# EAGLE design new_horna_podstava (EAGLE 9.6.2)
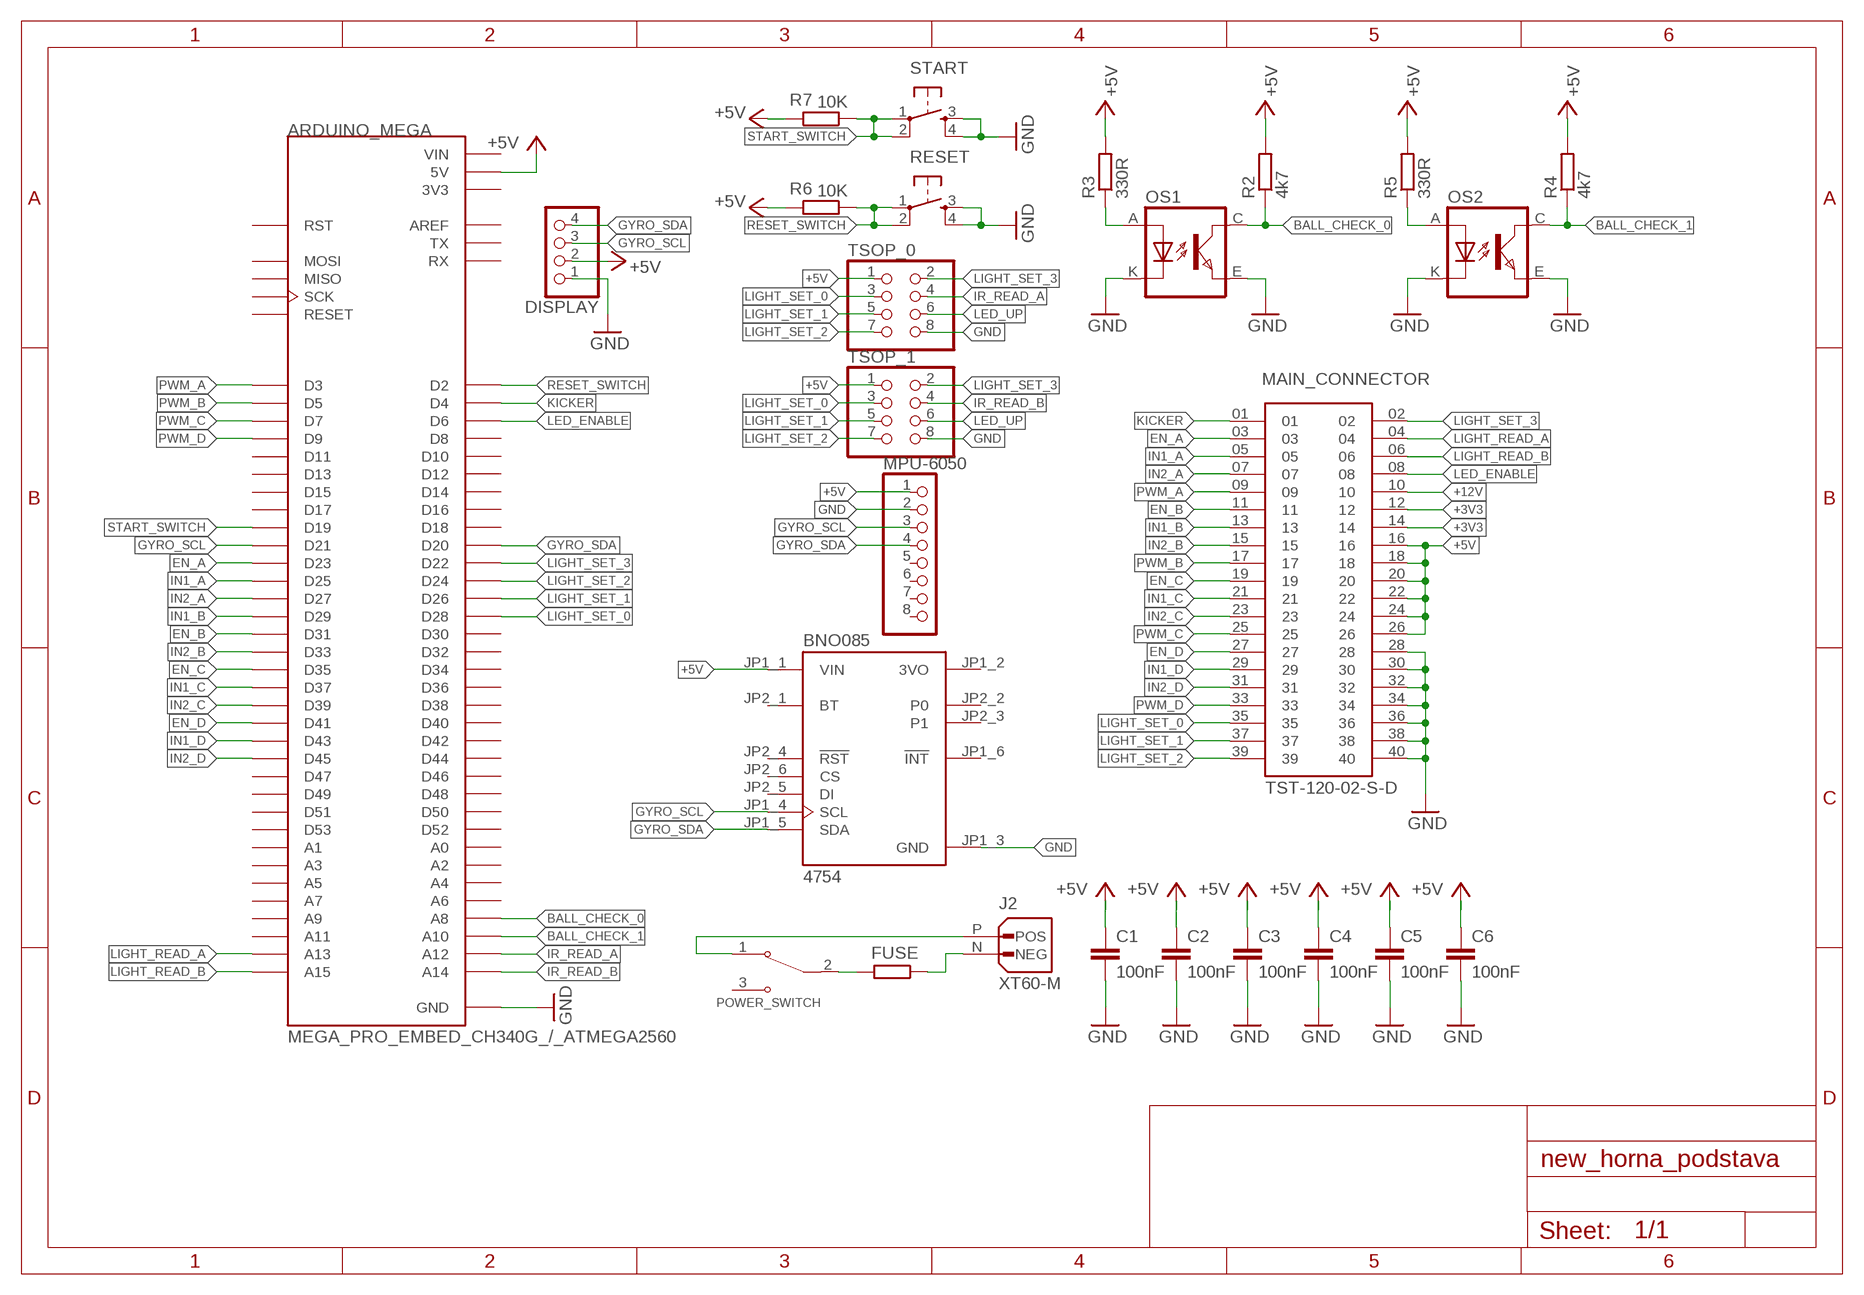
[diagram p0: schematic, sheet 1]

## Parts
ARDUINO_MEGA  MEGA_PRO_EMBED_CH340G_/_ATMEGA2560  [MODULE_MEGA_PRO_EMBED_CH340G_/_ATMEGA2560]
BNO085  4754  [MODULE_4754]
C1  100nF  C-EUC0805  [C0805]
C2  100nF  C-EUC0805  [C0805]
C3  100nF  C-EUC0805  [C0805]
C4  100nF  C-EUC0805  [C0805]
C5  100nF  C-EUC0805  [C0805]
C6  100nF  C-EUC0805  [C0805]
DISPLAY  PINHD-1X4  [1X04]
FUSE  R-EU_R1206  [R1206]
J2  XT60-M  [AMASS_XT60-M]
MAIN_CONNECTOR  TST-120-02-S-D  [SAMTEC_TST-120-02-S-D]
MPU-6050  PINHD-1X8  [1X08]
OS1  TCRT5000  [TCRT5000]
OS2  TCRT5000  [TCRT5000]
POWER_SWITCH  100SP1T1B4M2QE  [SW_100SP1T1B4M2QE]
R2  4k7  R-EU_R1206  [R1206]
R3  330R  R-EU_R1206  [R1206]
R4  4k7  R-EU_R1206  [R1206]
R5  330R  R-EU_R1206  [R1206]
R6  10K  R-EU_R1206  [R1206]
R7  10K  R-EU_R1206  [R1206]
RESET  DTSM-6  [DTSM-6]
START  DTSM-6  [DTSM-6]
TSOP_0  PINHD-2X4  [2X04]
TSOP_1  PINHD-2X4  [2X04]

## Nets
+3V3: MAIN_CONNECTOR.12 MAIN_CONNECTOR.14
+5V: ARDUINO_MEGA.5V_1(5V) ARDUINO_MEGA.5V_2(5V) ARDUINO_MEGA.5V_3(5V) BNO085.JP1_1(VIN) C1.1 C2.1 C3.1 C4.1 C5.1 C6.1 DISPLAY.2 MAIN_CONNECTOR.16 MAIN_CONNECTOR.18 MAIN_CONNECTOR.20 MAIN_CONNECTOR.22 MAIN_CONNECTOR.24 MAIN_CONNECTOR.26 MPU-6050.1 R2.2 R3.2 R4.2 R5.2 R6.2 R7.2 TSOP_0.1 TSOP_1.1
+12V: MAIN_CONNECTOR.10
BALL_CHECK_0: ARDUINO_MEGA.A8 OS1.C(COLLECTOR) R2.1
BALL_CHECK_1: ARDUINO_MEGA.A10 OS2.C(COLLECTOR) R4.1
EN_A: ARDUINO_MEGA.D23 MAIN_CONNECTOR.03
EN_B: ARDUINO_MEGA.D31 MAIN_CONNECTOR.11
EN_C: ARDUINO_MEGA.D35 MAIN_CONNECTOR.19
EN_D: ARDUINO_MEGA.D41 MAIN_CONNECTOR.27
GND: ARDUINO_MEGA.GND_1(GND) ARDUINO_MEGA.GND_2(GND) ARDUINO_MEGA.GND_3(GND) BNO085.JP1_3(GND) C1.2 C2.2 C3.2 C4.2 C5.2 C6.2 DISPLAY.1 MAIN_CONNECTOR.28 MAIN_CONNECTOR.30 MAIN_CONNECTOR.32 MAIN_CONNECTOR.34 MAIN_CONNECTOR.36 MAIN_CONNECTOR.38 MAIN_CONNECTOR.40 MPU-6050.2 OS1.E(EMITTER) OS1.K(CATHODE) OS2.E(EMITTER) OS2.K(CATHODE) RESET.3 RESET.4 START.3 START.4 TSOP_0.8 TSOP_1.8
GYRO_SCL: ARDUINO_MEGA.D21 BNO085.JP1_4(SCL) DISPLAY.3 MPU-6050.3
GYRO_SDA: ARDUINO_MEGA.D20 BNO085.JP1_5(SDA) DISPLAY.4 MPU-6050.4
IN1_A: ARDUINO_MEGA.D25 MAIN_CONNECTOR.05
IN1_B: ARDUINO_MEGA.D29 MAIN_CONNECTOR.13
IN1_C: ARDUINO_MEGA.D37 MAIN_CONNECTOR.21
IN1_D: ARDUINO_MEGA.D43 MAIN_CONNECTOR.29
IN2_A: ARDUINO_MEGA.D27 MAIN_CONNECTOR.07
IN2_B: ARDUINO_MEGA.D33 MAIN_CONNECTOR.15
IN2_C: ARDUINO_MEGA.D39 MAIN_CONNECTOR.23
IN2_D: ARDUINO_MEGA.D45 MAIN_CONNECTOR.31
IR_READ_A: ARDUINO_MEGA.A12 TSOP_0.4
IR_READ_B: ARDUINO_MEGA.A14 TSOP_1.4
KICKER: ARDUINO_MEGA.D4 MAIN_CONNECTOR.01
LED_ENABLE: ARDUINO_MEGA.D6 MAIN_CONNECTOR.08
LED_UP: TSOP_0.6 TSOP_1.6
LIGHT_READ_A: ARDUINO_MEGA.A13 MAIN_CONNECTOR.04
LIGHT_READ_B: ARDUINO_MEGA.A15 MAIN_CONNECTOR.06
LIGHT_SET_0: ARDUINO_MEGA.D28 MAIN_CONNECTOR.35 TSOP_0.3 TSOP_1.3
LIGHT_SET_1: ARDUINO_MEGA.D26 MAIN_CONNECTOR.37 TSOP_0.5 TSOP_1.5
LIGHT_SET_2: ARDUINO_MEGA.D24 MAIN_CONNECTOR.39 TSOP_0.7 TSOP_1.7
LIGHT_SET_3: ARDUINO_MEGA.D22 MAIN_CONNECTOR.02 TSOP_0.2 TSOP_1.2
N$1: FUSE.2 POWER_SWITCH.2
N$2: J2.P(POS) POWER_SWITCH.1
N$3: FUSE.1 J2.N(NEG)
N$5: OS2.A(ANODE) R5.1
N$6: OS1.A(ANODE) R3.1
PWM_A: ARDUINO_MEGA.D3 MAIN_CONNECTOR.09
PWM_B: ARDUINO_MEGA.D5 MAIN_CONNECTOR.17
PWM_C: ARDUINO_MEGA.D7 MAIN_CONNECTOR.25
PWM_D: ARDUINO_MEGA.D9 MAIN_CONNECTOR.33
RESET_SWITCH: ARDUINO_MEGA.D2 R6.1 RESET.1 RESET.2
START_SWITCH: ARDUINO_MEGA.D19 R7.1 START.1 START.2
Unconnected: ARDUINO_MEGA.A0 ARDUINO_MEGA.A1 ARDUINO_MEGA.A2 ARDUINO_MEGA.A3 ARDUINO_MEGA.A4 ARDUINO_MEGA.A5 ARDUINO_MEGA.A6 ARDUINO_MEGA.A7 ARDUINO_MEGA.A9 ARDUINO_MEGA.A11 ARDUINO_MEGA.AREF ARDUINO_MEGA.D8 ARDUINO_MEGA.D10 ARDUINO_MEGA.D11 ARDUINO_MEGA.D12 ARDUINO_MEGA.D13 ARDUINO_MEGA.D14 ARDUINO_MEGA.D15 ARDUINO_MEGA.D16 ARDUINO_MEGA.D17 ARDUINO_MEGA.D18 ARDUINO_MEGA.D30 ARDUINO_MEGA.D32 ARDUINO_MEGA.D34 ARDUINO_MEGA.D36 ARDUINO_MEGA.D38 ARDUINO_MEGA.D40 ARDUINO_MEGA.D42 ARDUINO_MEGA.D44 ARDUINO_MEGA.D46 ARDUINO_MEGA.D47 ARDUINO_MEGA.D48 ARDUINO_MEGA.D49 ARDUINO_MEGA.D50 ARDUINO_MEGA.D51 ARDUINO_MEGA.D52 ARDUINO_MEGA.D53 ARDUINO_MEGA.MISO ARDUINO_MEGA.MOSI ARDUINO_MEGA.RESET ARDUINO_MEGA.RST ARDUINO_MEGA.RX ARDUINO_MEGA.SCK ARDUINO_MEGA.TX ARDUINO_MEGA.VIN_1(VIN) ARDUINO_MEGA.VIN_2(VIN) BNO085.JP1_2(3VO) BNO085.JP1_6(!INT) BNO085.JP2_1(BT) BNO085.JP2_2(P0) BNO085.JP2_3(P1) BNO085.JP2_4(!RST) BNO085.JP2_5(DI) BNO085.JP2_6(CS) MPU-6050.5 MPU-6050.6 MPU-6050.7 MPU-6050.8 POWER_SWITCH.3

## Power pins joined to a net without a drawn wire
3V3: ARDUINO_MEGA.3V3_1(3V3) ARDUINO_MEGA.3V3_2(3V3)

## Library data of the parts
ARDUINO_MEGA = MEGA_PRO_EMBED_CH340G___ATMEGA2560:MEGA_PRO_EMBED_CH340G_/_ATMEGA2560: Mega 2560 PRO (Embed) CH340G/ATmega2560-16AU Check availability <https://pricing.snapeda.com/parts/Mega%20Pro%20Embed%20CH340G%20/%20ATmega2560/Robotdyn/view-part?ref=eda>; AVAILABILITY: Not in stock; MF: Robotdyn; MP: Mega Pro Embed CH340G / ATmega2560; PACKAGE: None; PRICE: None
BNO085 = 4754:4754: Check availability <https://pricing.snapeda.com/parts/4754/Adafruit/view-part?ref=eda>; AVAILABILITY: In Stock; DESCRIPTION: Adafruit 9-DOF Orientation IMU Fusion Breakout - BNO085 (BNO080) - STEMMA QT / Qwiic; MF: Adafruit; MP: 4754; PACKAGE: None; PRICE: None; PURCHASE-URL: https://pricing.snapeda.com/search/part/4754/?ref=eda
C1-C6 = rcl:C-EU: CAPACITOR, European symbol; SPICEPREFIX: C
DISPLAY = pinhead:PINHD-1X4: PIN HEADER
FUSE R2-R7 = rcl:R-EU_: RESISTOR, European symbol; SPICEPREFIX: R
J2 = XT60-M:XT60-M: Check availability <https://pricing.snapeda.com/parts/XT60-M/AMASS/view-part?ref=eda>; AVAILABILITY: Not in stock; DESCRIPTION: Plug; DC supply; XT60; male; PIN: 2; for cable; soldered; 30A; 500V; MF: AMASS; MP: XT60-M; PACKAGE: Package; PRICE: None
MAIN_CONNECTOR = TST-120-02-S-D:TST-120-02-S-D: Check availability <https://pricing.snapeda.com/parts/TST-120-02-S-D-20/Samtec/view-part?ref=eda>; AVAILABILITY: In Stock; DESCRIPTION: Connector Header Through Hole 40 position 0.100 (2.54mm); MF: Samtec; MP: TST-120-02-S-D-20; PACKAGE: None; PRICE: None; PURCHASE-URL: https://pricing.snapeda.com/search/part/TST-120-02-S-D-20/?ref=eda
MPU-6050 = pinhead:PINHD-1X8: PIN HEADER
OS1 OS2 = tcrt5000:TCRT5000
POWER_SWITCH = 100SP1T1B4M2QE:100SP1T1B4M2QE: Toggle Switch SPDT Through Hole Check availability <https://pricing.snapeda.com/parts/100SP1T1B4M2QE/E-Switch/view-part?ref=eda>; AVAILABILITY: In Stock; DESCRIPTION: Toggle Switch SPDT Through Hole; MF: E-Switch; MP: 100SP1T1B4M2QE; PACKAGE: None; PRICE: None; PURCHASE-URL: https://pricing.snapeda.com/search/part/100SP1T1B4M2QE/?ref=eda
RESET START = switch-tact:DTSM-6
TSOP_0 TSOP_1 = pinhead:PINHD-2X4: PIN HEADER

## Board
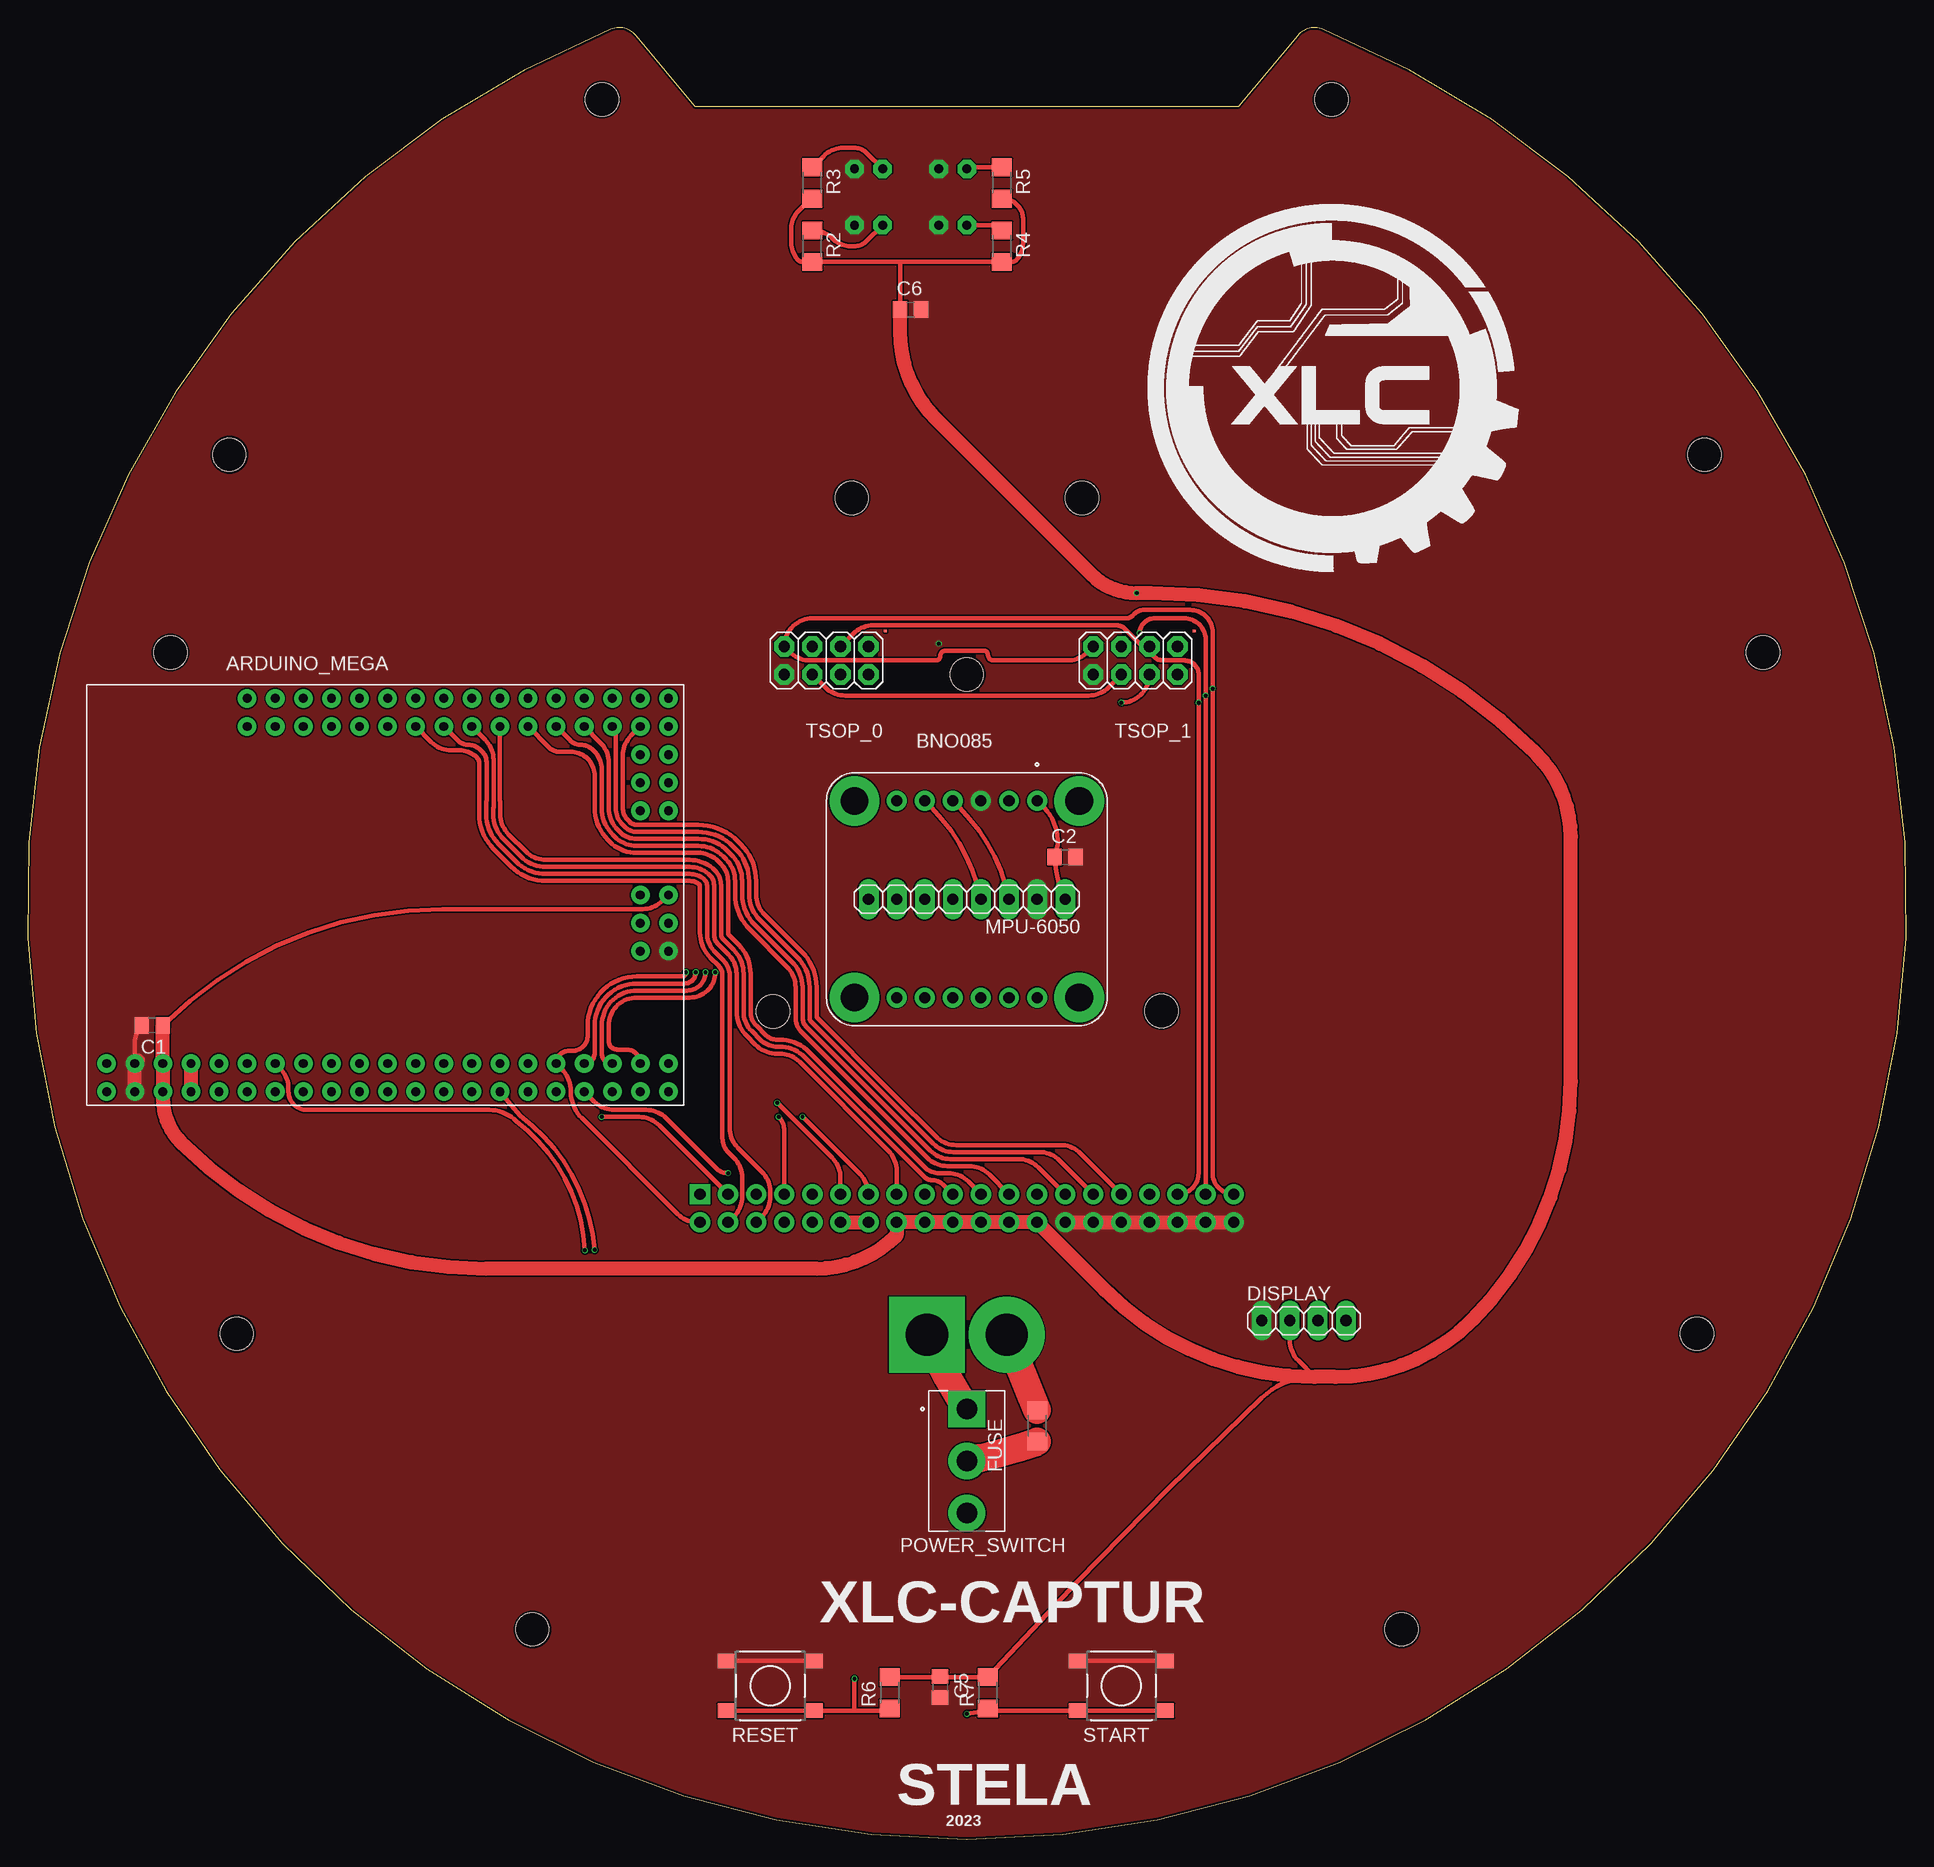
[diagram p1: board, top side]
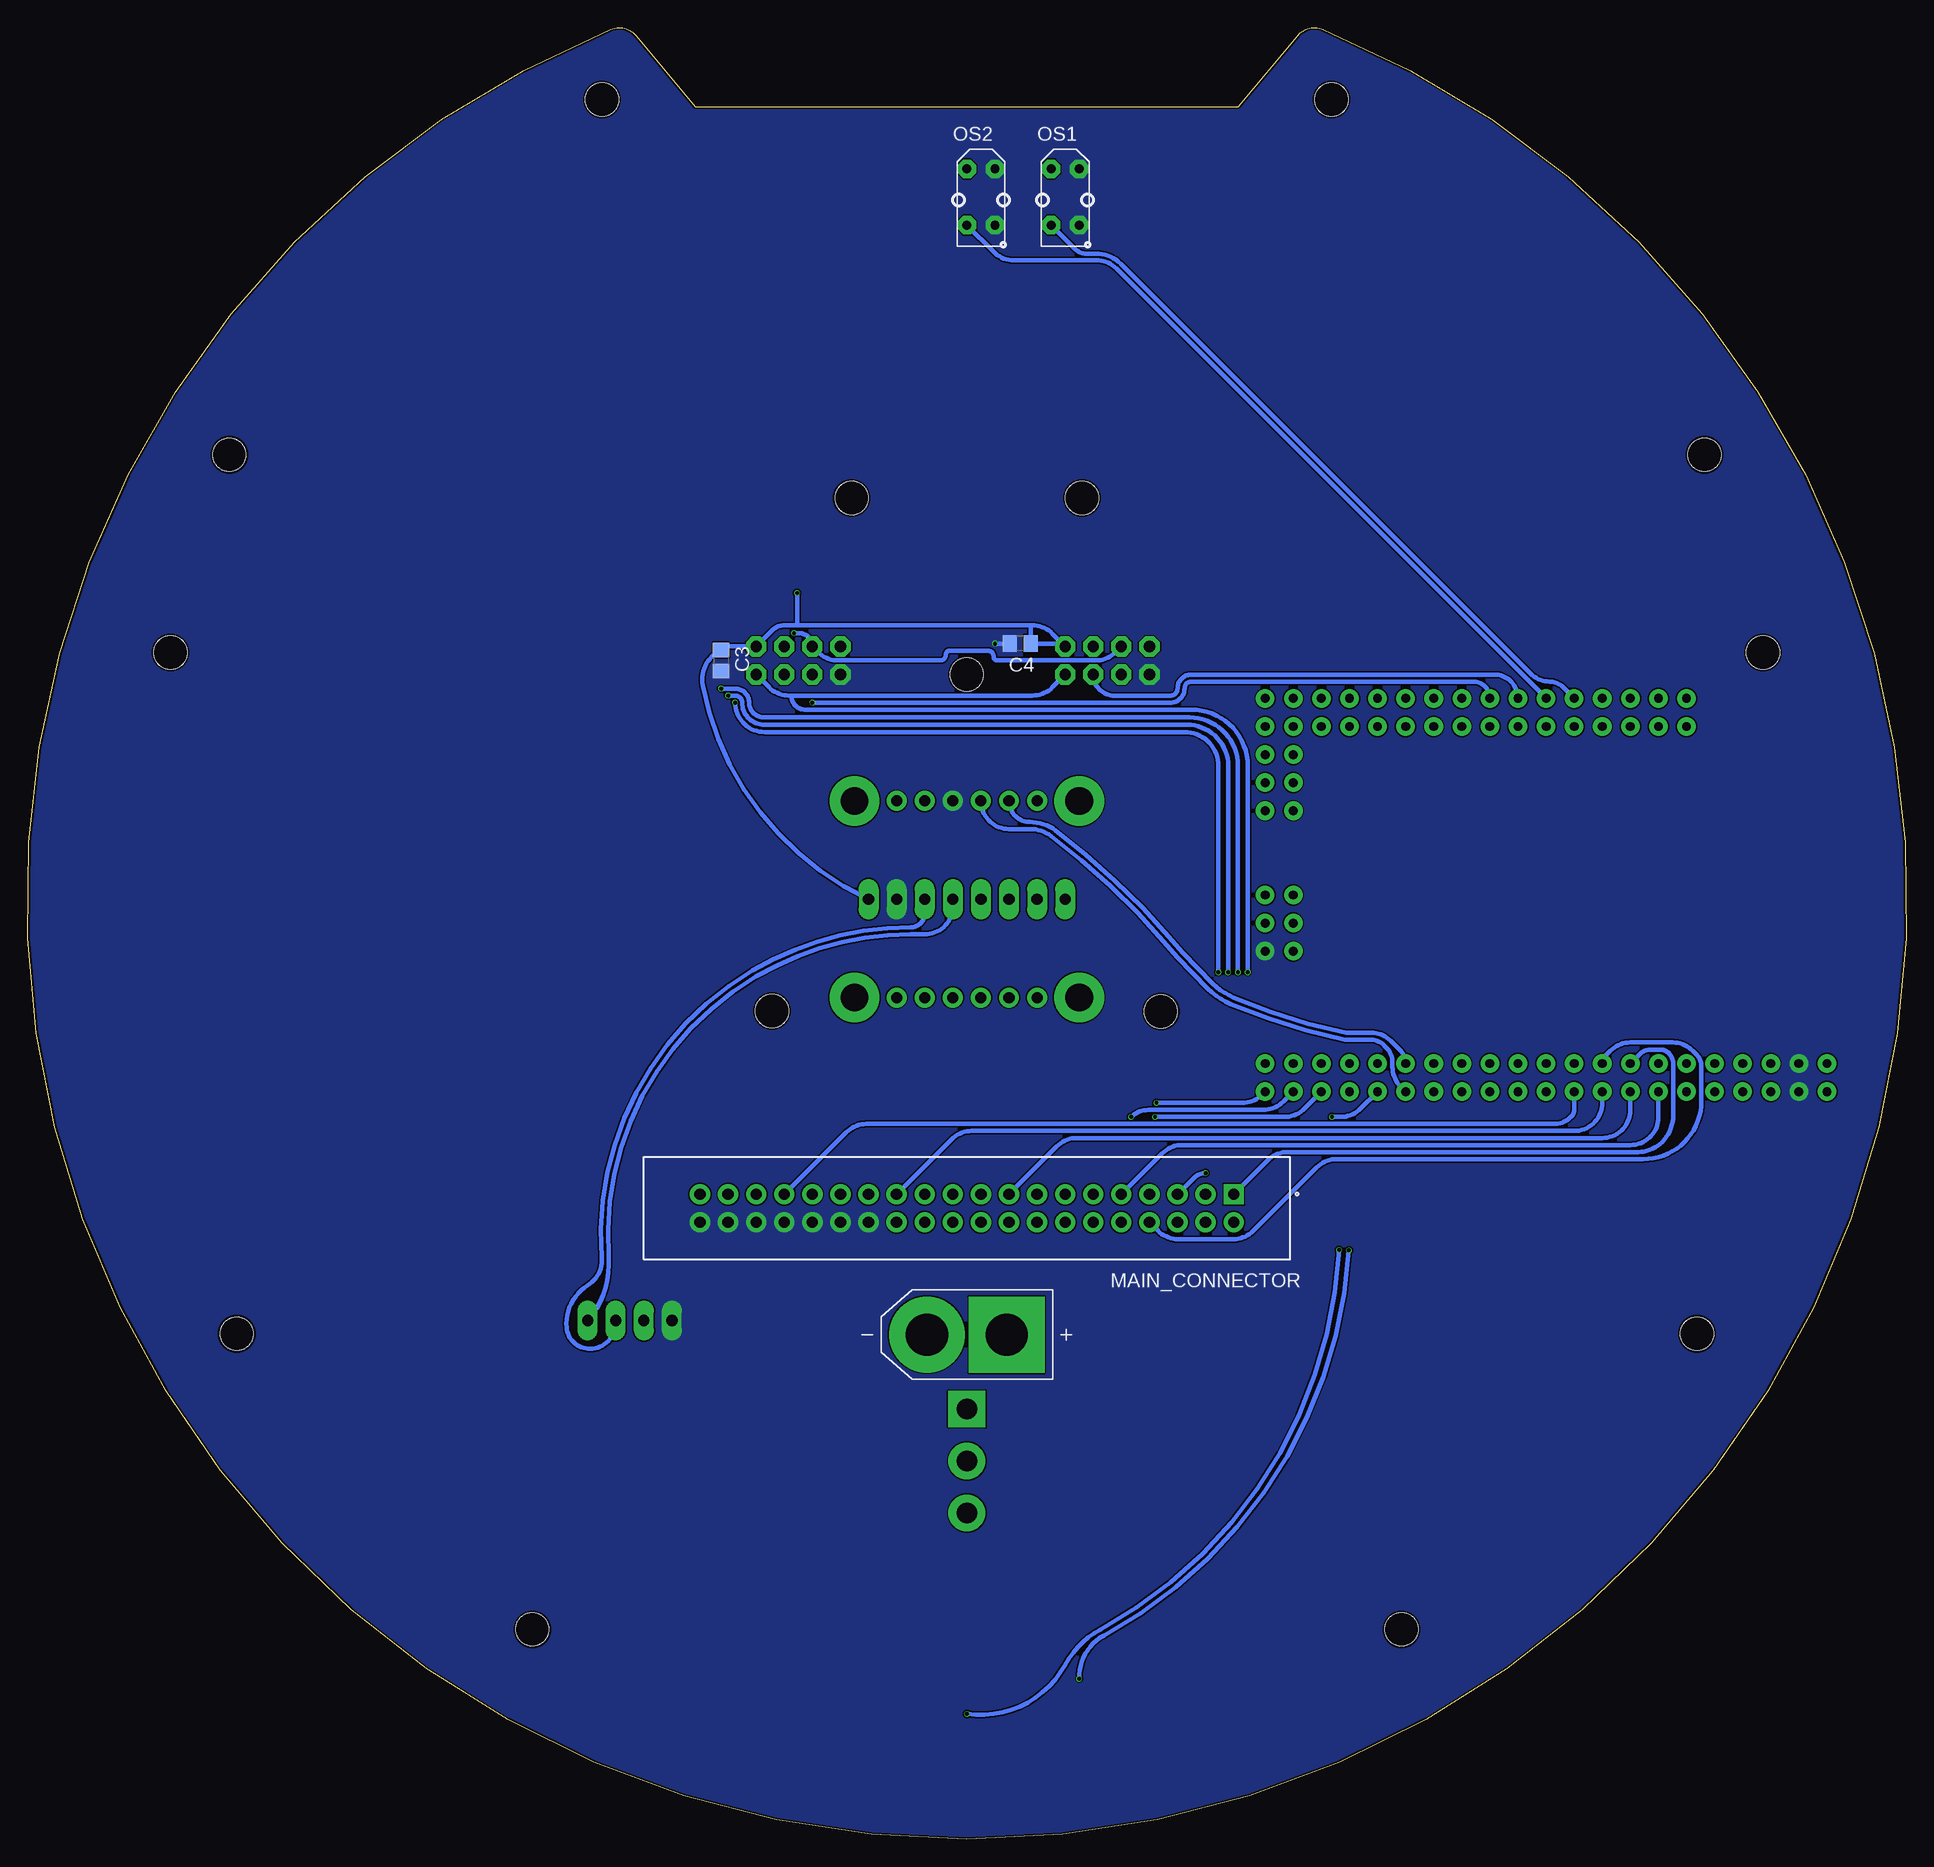
[diagram p2: board, bottom side, seen from below]

Size 169.86 x 163.81 mm. Coordinates in mm from the lower left corner, seen from the top.
Outline: 60.37,156.65 55.03,163.09 arc73 52.73,163.67 arc315 117.13,163.67 arc73 114.83,163.09 109.48,156.65 60.37,156.65
Copper layers (1*16): Top 0.035mm / dielectric 1.6mm / Bottom 0.035mm
Design rules "jlc_pcb": minimum track width 5mil, minimum drill 0.3mm, track to track 5mil, track to pad 5mil, pad to pad 5mil, via to via 5mil, smd to smd 5mil, copper to edge 0.2mm, drill to drill 6mil, minimum pad ring 10mil, minimum via ring 3mil, stop-mask expansion 4mil, vias tented up to drill 0mil, thermal gap 10mil
Holes 3 mm at 156.93,107.32 12.93,107.32 102.54,74.9 67.39,74.86 84.93,105.32 151.62,125.19 150.94,45.71 124.22,18.98 95.34,121.27 74.51,121.27 45.64,18.98 18.91,45.71 18.24,125.19 117.91,157.32 51.94,157.32

### Footprints (pad centres in the part's own frame; a part is rotated, then mirrored left to right if it is on the bottom)
MODULE_MEGA_PRO_EMBED_CH340G_/_ATMEGA2560 = drill 0.8 pad 1.676: 3V3_1 -17.58,-17.78; 3V3_2 -17.58,-15.24; 5V_1 -20.12,-17.78; 5V_2 -20.12,-15.24; 5V_3 25.6,0; A0 -12.5,17.78; A1 -12.5,15.24; A2 -9.96,17.78; A3 -9.96,15.24; A4 -7.42,17.78; A5 -7.42,15.24; A6 -4.88,17.78; A7 -4.88,15.24; A8 -2.34,17.78; A9 -2.34,15.24; A10 0.2,17.78; A11 0.2,15.24; A12 2.74,17.78; A13 2.74,15.24; A14 5.28,17.78; A15 5.28,15.24; AREF -15.04,-15.24; D2 -9.96,-15.24; D3 -9.96,-17.78; D4 -7.42,-15.24; D5 -7.42,-17.78; D6 -4.88,-15.24; D7 -4.88,-17.78; D8 -2.34,-15.24; D9 -2.34,-17.78; D10 0.2,-15.24; D11 0.2,-17.78; D12 2.74,-15.24; D13 2.74,-17.78; D14 5.28,-15.24; D15 5.28,-17.78; D16 7.82,-15.24; D17 7.82,-17.78; D18 10.36,-15.24; D19 10.36,-17.78; D20 12.9,-15.24; D21 12.9,-17.78; D22 15.44,-15.24; D23 15.44,-17.78; D24 17.98,-15.24; D25 17.98,-17.78; D26 20.52,-15.24; D27 20.52,-17.78; D28 23.06,-15.24; D29 23.06,-17.78; D30 25.6,-15.24; D31 25.6,-17.78; D32 7.82,17.78; D33 7.82,15.24; D34 10.36,17.78; D35 10.36,15.24; D36 12.9,17.78; D37 12.9,15.24; D38 15.44,17.78; D39 15.44,15.24; D40 17.98,17.78; D41 17.98,15.24; D42 20.52,17.78; D43 20.52,15.24; D44 23.06,17.78; D45 23.06,15.24; D46 25.6,17.78; D47 25.6,15.24; D48 25.6,12.7; D49 23.06,12.7; D50 25.6,10.16; D51 23.06,10.16; D52 25.6,7.62; D53 23.06,7.62; GND_1 -22.66,-17.78; GND_2 -22.66,-15.24; GND_3 25.6,-5.08; MISO 23.06,0; MOSI 25.6,-2.54; RESET 23.06,-5.08; RST -15.04,-17.78; RX -12.5,-15.24; SCK 23.06,-2.54; TX -12.5,-17.78; VIN_1 -25.2,-17.78; VIN_2 -25.2,-15.24
MODULE_4754 = drill 1 pad 1.778: JP1_1 -6.35,-8.89; JP1_2 -3.81,-8.89; JP1_3 -1.27,-8.89; JP1_4 1.27,-8.89; JP1_5 3.81,-8.89; JP1_6 6.35,-8.89; JP2_1 -6.35,8.89; JP2_2 -3.81,8.89; JP2_3 -1.27,8.89; JP2_4 1.27,8.89; JP2_5 3.81,8.89; JP2_6 6.35,8.89 | drill 2.5 pad 3.2: P1 -10.16,8.89; P2 10.16,8.89; P3 -10.16,-8.89; P4 10.16,-8.89
C0805 = smd 1.3 x 1.5: 1 -0.95,0; 2 0.95,0
1X04 = drill 1.016 long: 1 -3.81,0; 2 -1.27,0; 3 1.27,0; 4 3.81,0
R1206 = smd 1.6 x 1.803: 1 -1.422,0; 2 1.422,0
AMASS_XT60-M = drill 3.81 pad 5.08: N 3.6,0 | drill 3.81 pad 5.08 square: P -3.6,0
SAMTEC_TST-120-02-S-D = drill 1.02 pad 1.37 square: 01 0,0 | drill 1.02 pad 1.37: 02 0,2.54; 03 2.54,0; 04 2.54,2.54; 05 5.08,0; 06 5.08,2.54; 07 7.62,0; 08 7.62,2.54; 09 10.16,0; 10 10.16,2.54; 11 12.7,0; 12 12.7,2.54; 13 15.24,0; 14 15.24,2.54; 15 17.78,0; 16 17.78,2.54; 17 20.32,0; 18 20.32,2.54; 19 22.86,0; 20 22.86,2.54; 21 25.4,0; 22 25.4,2.54; 23 27.94,0; 24 27.94,2.54; 25 30.48,0; 26 30.48,2.54; 27 33.02,0; 28 33.02,2.54; 29 35.56,0; 30 35.56,2.54; 31 38.1,0; 32 38.1,2.54; 33 40.64,0; 34 40.64,2.54; 35 43.18,0; 36 43.18,2.54; 37 45.72,0; 38 45.72,2.54; 39 48.26,0; 40 48.26,2.54
1X08 = drill 1.016 long: 1 -8.89,0; 2 -6.35,0; 3 -3.81,0; 4 -1.27,0; 5 1.27,0; 6 3.81,0; 7 6.35,0; 8 8.89,0
TCRT5000 = drill 0.8 pad 1.676 octagon: A -2.54,-1.27; C 2.54,-1.27; E 2.54,1.27; K -2.54,1.27
SW_100SP1T1B4M2QE = drill 1.85 square: 1 0,4.7 | drill 1.85: 2 0,0; 3 0,-4.7
DTSM-6 = smd 1.55 x 1.3: 1 -3.975,2.25; 2 3.975,2.25; 3 -3.975,-2.25; 4 3.975,-2.25
2X04 = drill 1.016 octagon: 1 -3.81,-1.27; 2 -3.81,1.27; 3 -1.27,-1.27; 4 -1.27,1.27; 5 1.27,-1.27; 6 1.27,1.27; 7 3.81,-1.27; 8 3.81,1.27 | smd 0.254 x 0.254: P$1 -5.334,-2.667

### Placement (x,y rotation side)
ARDUINO_MEGA  32.35,85.38 0 top
BNO085  84.93,85 180 top
C1  11.27,73.57 180 top
C2  93.82,88.81 0 top
C3  107.15,106.59 270 bottom
C4  80.1,108.11 180 bottom
C5  82.51,13.75 270 top
C6  79.85,138.34 0 top
DISPLAY  115.41,46.9 0 top
FUSE  91.28,37.38 270 top
J2  84.93,45.63 180 bottom
MAIN_CONNECTOR  60.8,58.33 180 bottom
MPU-6050  84.93,85 180 top
OS1  76.04,148.5 270 bottom
OS2  83.66,148.5 270 bottom
POWER_SWITCH  84.93,34.2 0 top
R2  70.96,144.06 270 top
R3  70.96,149.77 270 top
R4  88.1,144.06 270 top
R5  88.1,149.77 270 top
R6  77.94,13.25 90 top
R7  86.83,13.25 90 top
RESET  67.15,13.88 180 top
START  98.9,13.88 180 top
TSOP_0  72.23,106.59 180 top
TSOP_1  100.17,106.59 180 top

### Tracks (layer width: path | path; a pad name or v marks a point on that pad's centre or on a via)
3V3
  Top 1.27: ARDUINO_MEGA.3V3_2 ARDUINO_MEGA.3V3_1
+3V3
  Top 1.27: MAIN_CONNECTOR.12 MAIN_CONNECTOR.14
+5V  (via drill 0.35)
  Top 0.406: 78.96,142.63 R4.2 89.01,142.63 arc45 89.37,142.79 arc45 90.01,144.32 90.01,146.6 arc45 89.56,147.68 89.37,147.87 arc45 88.21,148.35 R5.2 | R3.2 arc45 70.7,148.24 69.69,147.23 arc45 69.05,145.7 69.05,144.32 arc45 69.69,142.79 arc45 70.05,142.63 R2.2 71.59,142.63 78.96,142.63 | C6.1 78.9,142.49 arc-45 78.96,142.63 | ARDUINO_MEGA.5V_3 57.42,84.86 arc-45 55.63,84.11 37.49,84.11 arc45 12.41,73.72 12.23,73.54 | DISPLAY.2 114.14,45.09 arc45 114.88,43.29 116.36,41.82 arc44 111.6,39.92 arc4 R7.2 82.39,14.67 | R6.2 82.39,14.67 | C5.1 82.39,14.67 | BNO085.JP1_1 91.91,93.26 arc-66 C2.1 92.93,88.18 arc20 MPU-6050.1
  Top 1.27: C6.1 78.9,136.36 arc45 82.21,128.36 96.19,114.38 arc45 v100.27,112.69 101.52,112.69 arc-45 136.28,98.29 136.45,98.13 arc-45 139.54,90.66 139.54,68.5 arc-45 130.6,46.93 arc-45 118.26,41.82 116.36,41.82 arc-45 97.39,49.68 MAIN_CONNECTOR.26 MAIN_CONNECTOR.24 MAIN_CONNECTOR.22 MAIN_CONNECTOR.20 MAIN_CONNECTOR.18 MAIN_CONNECTOR.16 78.58,54.62 arc-45 71.29,51.6 41.47,51.6 arc-45 13.84,63.05 arc-45 12.23,66.94 ARDUINO_MEGA.5V_1 ARDUINO_MEGA.5V_2 12.23,73.54 arc45 C1.1
  Bottom 0.406: 79.21,109.77 78.99,109.77 arc45 77.2,109.02 TSOP_0.1 arc-45 76.65,108.11 C4.1 79.15,109.62 arc-45 79.21,109.77 | 79.21,109.77 100.27,109.77 | 100.27,109.77 101.45,109.77 arc-45 102.51,109.33 TSOP_1.1 106.38,107.86 arc-45 C3.1 107.64,107.21 arc-66 108.81,104.36 arc-54 MPU-6050.1 | v100.27,112.69 100.27,109.77
BALL_CHECK_0
  Top 0.406: R2.1 71.02,145.48 arc-45 72.82,144.73 72.86,144.69 arc45 74.4,144.06 74.77,144.06 arc45 75.85,144.5 OS1.C
  Bottom 0.406: ARDUINO_MEGA.A8 31.05,104.2 arc-45 32.22,104.69 arc45 33.96,105.4 71.02,142.46 arc-45 73.24,143.38 74.13,143.38 arc45 75.15,143.81 OS1.C
BALL_CHECK_1
  Top 0.406: OS2.C 86.94,145.96 arc-45 R4.1
  Bottom 0.406: ARDUINO_MEGA.A10 71.43,142.04 arc-45 73.23,142.79 80.7,142.79 arc45 82.5,143.53 OS2.C
EN_A  (via drill 0.35)
  Top 0.406: v51.91,65.32 55.3,65.32 arc-45 57.1,64.57 MAIN_CONNECTOR.03
  Bottom 0.406: ARDUINO_MEGA.D23 49.33,66.06 arc45 51.13,65.32 v51.91,65.32
EN_B  (via drill 0.35)
  Top 0.406: v67.78,66.59 72.75,61.61 arc-45 73.5,59.82 MAIN_CONNECTOR.11
  Bottom 0.406: ARDUINO_MEGA.D31 58.22,67.33 arc45 60.02,66.59 v67.78,66.59
EN_C
  Top 0.406: ARDUINO_MEGA.D35 42.71,93.89 42.74,93.86 42.74,92.68 arc45 43.48,90.89 45.07,89.3 arc45 46.86,88.56 59.88,88.56 arc-45 62.14,87.62 arc-45 62.7,86.27 62.7,81.83 | 62.7,81.83 arc45 62.7,81.83 | 62.7,81.83 arc45 62.89,81.38 63.84,80.42 arc-45 64.73,78.27 64.73,74.84 arc45 65.46,73.09 66.25,72.3 arc45 67.78,71.67 68,71.67 arc-45 70.25,70.74 81.12,59.86 arc45 81.75,59.6 arc-45 82.84,59.15 MAIN_CONNECTOR.19
EN_D
  Top 0.406: ARDUINO_MEGA.D41 51.8,99.15 arc-45 52.54,97.36 52.54,93.26 arc45 53.36,91.27 53.55,91.09 arc45 55.06,90.46 60.63,90.46 arc-45 63.33,89.35 63.6,89.07 arc-45 64.61,86.64 64.61,85.42 arc45 65.72,82.72 69.14,79.31 arc-45 70.07,77.06 70.07,74.33 arc45 70.44,73.43 81.63,62.25 arc45 83.42,61.51 89.59,61.51 arc-45 91.39,60.76 MAIN_CONNECTOR.27
GND  (via drill 0.35)
  Top 0.406: ARDUINO_MEGA.GND_2 9.97,70.42 | ARDUINO_MEGA.GND_2 ARDUINO_MEGA.GND_1 | ARDUINO_MEGA.GND_2 9.69,72.05 arc-45 C1.2 | RESET.4 RESET.3 | START.4 START.3
  Top 1.27: MAIN_CONNECTOR.28 MAIN_CONNECTOR.30 MAIN_CONNECTOR.32 MAIN_CONNECTOR.34 MAIN_CONNECTOR.36 MAIN_CONNECTOR.38 MAIN_CONNECTOR.40 | ARDUINO_MEGA.GND_1 9.69,69.74 arc-45 9.97,70.42
  Bottom 0.406: C4.2 v82.39,108.11
  pour Bottom (no thermals): -11.59,168.82 -11.59,-19.77 154.78,-19.77 188.43,-19.77 188.43,145.33 188.43,168.82
  pour Top (no thermals): -11.59,168.82 -11.59,-19.77 188.43,-19.77 188.43,168.82
GYRO_SCL
  Top 0.406: BNO085.JP1_4 84.29,93.26 arc-33 MPU-6050.3
  Bottom 0.406: ARDUINO_MEGA.D21 45.7,68.05 arc45 46.45,69.85 46.45,70.27 arc-45 46.99,71.57 47.18,71.76 arc-45 48.48,72.3 arc1 50.76,72.31 arc12 61.05,75.53 arc21 63.15,76.93 arc5 67.15,81.19 arc-13 77.31,90.72 arc-37 79.21,91.35 81.12,91.35 arc90 BNO085.JP1_4 | MPU-6050.3 88.74,83.73 arc90 90.01,82.46 arc-31 104.3,78.56 arc-64 117.95,52.57 arc62 119.22,50.08 arc-63 121.12,46.27 arc-80 119.22,44.36 arc-100 DISPLAY.3
GYRO_SDA
  Top 0.406: BNO085.JP1_5 81.75,93.26 arc-33 MPU-6050.4
  Bottom 0.406: ARDUINO_MEGA.D20 arc-45 45.75,71.35 46.62,72.22 arc-45 48.35,72.94 50.64,72.94 arc12 60.8,76.11 arc21 62.7,77.38 arc5 66.67,81.6 arc-13 76.93,91.22 arc-37 79.21,91.99 arc90 BNO085.JP1_5 | MPU-6050.4 86.2,84.37 arc90 88.74,81.83 90.01,81.83 arc-31 103.98,78.02 arc-64 117.31,52.62 arc45 DISPLAY.4
IN1_A  (via drill 0.35)
  Top 0.406: ARDUINO_MEGA.D25 51.24,66.69 arc45 53.03,65.95 55.94,65.95 arc-45 57.73,65.21 62.25,60.68 arc45 v63.34,60.24
  Bottom 0.406: v63.34,60.24 arc-45 64.42,59.79 MAIN_CONNECTOR.05
IN1_B  (via drill 0.35)
  Top 0.406: MAIN_CONNECTOR.13 arc45 75.32,60.06 v70.07,65.32
  Bottom 0.406: ARDUINO_MEGA.D29 56.32,66.69 arc45 58.11,65.95 68.54,65.95 arc-45 v70.07,65.32
IN1_C
  Top 0.406: ARDUINO_MEGA.D37 47.14,98.73 arc45 48.1,98.34 49.1,98.34 arc-45 50.64,97.7 arc-45 51.27,96.17 51.27,93.26 arc45 52.47,90.38 52.65,90.19 arc45 55.06,89.19 60.63,89.19 arc-45 62.43,88.45 62.7,88.18 arc-45 63.34,86.64 63.34,84.15 | 63.34,84.15 arc-45 63.34,84.15 | 63.34,84.15 63.34,81.83 64.29,80.87 arc-45 65.37,78.27 65.37,74.84 arc45 65.91,73.54 66.7,72.75 arc45 67.78,72.3 68,72.3 arc-45 70.69,71.18 81.12,60.76 arc45 82.39,60.24 83.24,60.24 arc-45 85.04,59.49 MAIN_CONNECTOR.21
IN1_D
  Top 0.406: ARDUINO_MEGA.D43 arc-45 53.18,99.88 53.18,93.26 arc45 53.81,91.72 54,91.54 arc45 55.06,91.1 60.63,91.1 arc-45 63.78,89.79 64.05,89.52 arc-45 65.24,86.64 65.24,85.42 arc45 66.17,83.17 69.59,79.76 arc-45 70.7,77.06 70.7,74.33 arc45 70.89,73.88 81.89,62.88 arc45 83.68,62.14 91.5,62.14 arc-45 93.29,61.4 MAIN_CONNECTOR.29
IN2_A  (via drill 0.35)
  Top 0.406: MAIN_CONNECTOR.07 68.42,64.09 arc45 v67.91,65.32
  Bottom 0.406: ARDUINO_MEGA.D27 54.41,66.06 arc45 56.21,65.32 v67.91,65.32
IN2_B
  Top 0.406: ARDUINO_MEGA.D33 41.38,99.41 arc-45 42.13,97.61 42.13,93.28 42.1,93.26 42.1,92.68 arc45 43.03,90.44 44.62,88.85 arc45 46.86,87.92 59.88,87.92 arc-45 61.7,87.17 arc-45 62.07,86.27 62.07,81.83 | 62.07,81.83 arc45 62.07,81.83 | 62.07,81.83 arc45 62.44,80.93 63.39,79.97 arc-45 64.1,78.27 64.1,74.84 arc45 65.01,72.64 65.8,71.85 arc45 67.78,71.03 68,71.03 arc-45 69.8,70.29 77.83,62.25 arc-45 78.58,60.45 MAIN_CONNECTOR.15
IN2_C
  Top 0.406: ARDUINO_MEGA.D39 49.04,99.37 arc45 50,98.97 arc-45 51.09,98.52 51.27,98.34 arc-45 51.91,96.8 51.91,93.26 arc45 52.91,90.82 53.1,90.64 arc45 55.06,89.83 60.63,89.83 arc-45 62.88,88.9 63.15,88.62 arc-45 63.97,86.64 63.97,85.42 arc45 65.27,82.27 68.69,78.86 arc-45 69.43,77.06 69.43,74.33 arc45 69.99,72.99 81.36,61.61 arc45 83.16,60.87 85.15,60.87 arc-45 86.94,60.13 MAIN_CONNECTOR.23
IN2_D
  Top 0.406: ARDUINO_MEGA.D45 54.56,99.77 arc45 53.81,97.97 53.81,93.26 arc45 54.26,92.17 54.45,91.99 arc45 55.06,91.73 60.63,91.73 arc-45 64.23,90.24 64.5,89.97 arc-45 65.88,86.64 65.88,85.42 arc45 66.62,83.62 70.04,80.21 arc-45 71.34,77.06 71.34,74.33 77.88,67.79 78.2,67.47 82.15,63.52 arc45 83.95,62.78 93.4,62.78 arc-45 95.2,62.03 MAIN_CONNECTOR.31
IR_READ_A
  Bottom 0.406: ARDUINO_MEGA.A12 arc-90 37.25,105.32 64.61,105.32 arc-90 65.88,104.05 arc90 66.51,103.42 69.05,103.42 71.59,103.42 arc90 TSOP_0.4
IR_READ_B  (via drill 0.35)
  Top 0.406: TSOP_1.4 arc-90 v98.9,102.78
  Bottom 0.406: ARDUINO_MEGA.A14 arc-90 39.15,104.69 64.61,104.69 arc-90 65.24,104.05 arc90 66.51,102.78 v98.9,102.78
KICKER
  Bottom 0.406: MAIN_CONNECTOR.01 57.73,61.4 arc45 55.94,62.14 24.23,62.14 arc-45 22.06,63.04 arc-45 21.05,65.48 21.05,70.06 arc-45 21.48,71.1 arc-45 22.22,71.41 23.08,71.41 arc-45 24.07,71 ARDUINO_MEGA.D4
LED_ENABLE
  Bottom 0.406: MAIN_CONNECTOR.08 67.64,55.01 arc-45 65.84,54.27 60.8,54.27 arc-45 59.06,54.98 53.29,60.76 arc45 51.49,61.51 23.75,61.51 arc-45 20.04,63.04 arc-45 18.51,66.75 18.51,69.89 arc-45 18.96,70.97 19.29,71.3 arc-45 21.08,72.05 24.95,72.05 arc-45 26.74,71.3 27.16,70.88 arc-45 ARDUINO_MEGA.D6
LED_UP
  Top 0.406: TSOP_0.6 72.12,104.16 arc45 73.91,103.42 95.94,103.42 arc45 97.74,104.16 TSOP_1.6
LIGHT_READ_A
  Top 0.406: ARDUINO_MEGA.A13 36.5,99.21 arc45 38.3,98.46 39.07,98.46 arc-45 40.6,97.83 arc-45 40.86,97.21 40.86,93.89 40.83,93.86 40.83,92.68 arc45 42.13,89.54 43.72,87.95 arc45 46.86,86.65 59.88,86.65 arc-45 60.8,86.27 60.8,81.98 arc45 61.73,79.72 62.49,78.96 arc-45 62.83,78.14 62.83,63.37 arc45 63.34,62.14 63.86,61.61 arc-45 64.61,59.82 64.61,58.11 arc-45 63.86,56.32 MAIN_CONNECTOR.04
LIGHT_READ_B
  Top 0.406: ARDUINO_MEGA.A15 38.88,99.37 arc45 39.84,98.97 arc-45 40.93,98.52 41.11,98.34 arc-45 41.49,97.42 41.49,93.89 41.47,93.86 41.47,92.68 arc45 42.58,89.99 44.17,88.4 arc45 46.86,87.29 59.88,87.29 arc-45 61.25,86.72 arc-45 61.43,86.27 61.43,81.99 arc45 62.18,80.19 62.95,79.42 arc-45 63.48,78.14 63.48,69.13 63.48,68.49 63.48,64.32 arc45 64.22,62.53 66.4,60.34 arc-45 67.15,58.55 67.15,58.11 arc-45 66.4,56.32 MAIN_CONNECTOR.06
LIGHT_SET_0  (via drill 0.35)
  Top 0.406: TSOP_0.3 74.66,109.02 arc-45 76.45,109.77 98.48,109.77 arc-45 99.19,109.47 100.8,107.86 TSOP_1.3 arc90 102.71,106.59 104.61,106.59 arc-90 105.88,105.32 v105.88,102.78 105.88,60.24 arc-90 MAIN_CONNECTOR.35 | ARDUINO_MEGA.D28 arc90 54.14,71.41 53.3,71.41 arc-90 52.54,72.17 52.54,73.57 arc-90 55.08,76.11 59.89,76.11 arc90 v62.18,78.4
  Bottom 0.406: v62.18,78.4 62.18,97.07 arc-90 65.23,100.11 103.22,100.11 arc90 v105.88,102.78
LIGHT_SET_1  (via drill 0.35)
  Top 0.406: MAIN_CONNECTOR.37 v106.52,103.42 106.52,108.5 arc90 104.61,110.4 101.9,110.4 arc90 v100.56,109.06 | ARDUINO_MEGA.D26 arc-90 51.91,71.1 51.91,73.57 arc-90 55.08,76.75 59.64,76.75 arc90 v61.29,78.4
  Bottom 0.406: TSOP_0.5 71.48,107.33 arc45 73.28,106.59 82.13,106.59 arc90 82.51,106.97 arc-90 83.02,107.48 86.45,107.48 arc-90 86.83,107.1 arc90 87.34,106.59 96.58,106.59 arc45 98.37,107.33 TSOP_1.5 arc-90 100.09,109.06 v100.56,109.06 | v61.29,78.4 61.29,97.07 arc-90 65.01,100.78 103.24,100.78 arc90 105.25,102.78 arc-90 105.88,103.42 v106.52,103.42
LIGHT_SET_2  (via drill 0.35)
  Top 0.406: TSOP_1.7 95.83,107.33 arc-45 94.04,106.59 87.34,106.59 arc-90 86.83,107.1 arc90 86.45,107.48 83.02,107.48 arc90 82.51,106.97 arc-90 82.13,106.59 70.74,106.59 arc-45 68.94,107.33 TSOP_0.7 arc-90 70.96,110.4 99.3,110.4 arc45 99.91,110.65 100.06,110.8 arc-45 100.93,111.16 105.12,111.16 arc-90 107.15,109.13 v107.15,104.05 107.15,60.24 arc90 MAIN_CONNECTOR.39 | ARDUINO_MEGA.D24 arc90 51.27,71.08 51.27,73.57 arc-90 55.08,77.38 59.39,77.38 arc90 v60.41,78.4
  Bottom 0.406: v60.41,78.4 60.41,97.07 arc-90 64.79,101.44 103.27,101.44 arc90 104.61,102.78 arc-90 105.88,104.05 v107.15,104.05
LIGHT_SET_3  (via drill 0.35)
  Top 0.406: MAIN_CONNECTOR.02 60.58,55.79 arc-45 58.78,56.53 50.09,65.23 arc-45 49.11,67.59 49.11,67.68 arc45 48.31,69.62 ARDUINO_MEGA.D22 arc-90 48.93,71.28 49.24,71.28 arc90 50.64,72.68 50.64,73.57 arc-90 55.08,78.02 59.15,78.02 arc90 v59.53,78.4
  Bottom 0.406: TSOP_1.2 102.82,104.16 arc-45 101.02,103.42 100.8,103.42 | TSOP_0.2 77.2,104.16 arc45 78.99,103.42 100.8,103.42 | 100.8,103.42 arc-90 99.53,102.15 64.61,102.15 arc90 59.53,97.07 v59.53,78.4
N$1
  Top 2.54: POWER_SWITCH.2 86.07,34.45 arc7 FUSE.2
N$2
  Top 2.54: POWER_SWITCH.1 84.29,39.92 arc-9 J2.P
N$3
  Top 2.54: FUSE.1 J2.N
N$5
  Top 0.406: OS2.A arc-45 85.29,151.19 R5.1
N$6
  Top 0.406: OS1.A 75.85,152.5 arc45 74.77,152.95 73.76,152.95 arc45 71.97,152.2 R3.1
PWM_A
  Bottom 0.406: ARDUINO_MEGA.D3 22.39,65.32 arc90 24.93,62.78 65.46,62.78 arc-45 67.26,62.03 MAIN_CONNECTOR.09
PWM_B
  Bottom 0.406: ARDUINO_MEGA.D5 24.93,65.95 arc90 27.47,63.41 74.99,63.41 arc-45 76.78,62.67 MAIN_CONNECTOR.17
PWM_C
  Bottom 0.406: ARDUINO_MEGA.D7 27.47,66.59 arc90 30.01,64.05 84.51,64.05 arc-45 86.31,63.3 MAIN_CONNECTOR.25
PWM_D
  Bottom 0.406: ARDUINO_MEGA.D9 30.01,65.95 arc45 30.24,65.39 30.32,65.32 arc45 31.85,64.68 94.04,64.68 arc-45 95.83,63.94 MAIN_CONNECTOR.33
RESET_SWITCH  (via drill 0.35)
  Top 0.406: ARDUINO_MEGA.D2 22.84,69.69 arc-45 23.59,67.89 23.59,67.6 arc90 25.24,65.95 41.75,65.95 arc-46 44.16,64.93 arc-50 v50.38,53.25 | RESET.2 RESET.1 74.77,11.63 | 74.77,11.63 77.94,11.63 R6.1 | v74.77,14.52 74.77,11.63
  Bottom 0.406: v50.38,53.25 arc58 72.56,18.4 arc-64 v74.77,14.52
START_SWITCH  (via drill 0.35)
  Top 0.406: ARDUINO_MEGA.D19 44.54,65.44 arc-48 v51.27,53.3 | 86.83,11.63 START.2 START.1 | 86.83,11.63 86.2,11.63 R7.1 | v84.93,11.34 86.83,11.63
  Bottom 0.406: v51.27,53.3 arc58 72.86,18.96 arc-33 76.04,15.79 arc70 v84.93,11.34

### Text on the board
tNames: XLC-CAPTUR | 2023 | STELA